# EAGLE schematic Schematic (EAGLE 9.7.0)
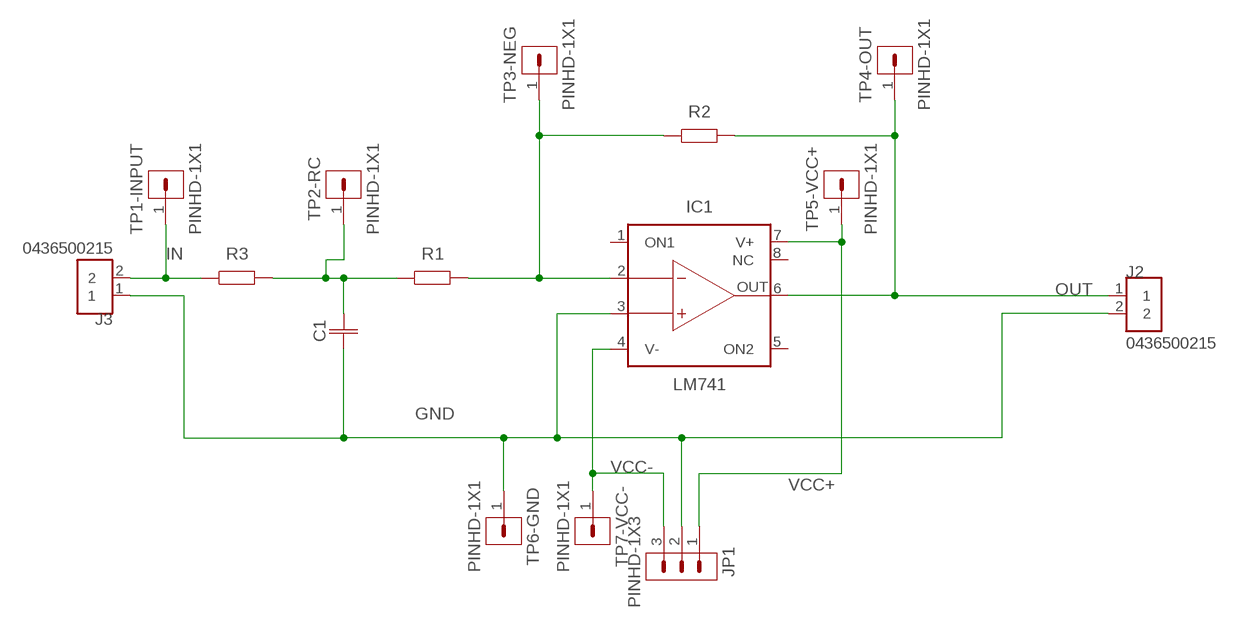
[diagram p0: schematic, sheet 1]

## Parts
C1  C_RADIAL-12.5MM-DIA  [CAPRD550W60D1025H1250B]
IC1  LM741  [DIP826W53P254L959H508Q8B]
J2  0436500215  [0436500215]
J3  0436500215  [0436500215]
JP1  PINHD-1X3  [1X03]
R1  R_AXIAL-7.2MM-PITCH  [RESAD724W46L381D178B]
R2  R_AXIAL-7.2MM-PITCH  [RESAD724W46L381D178B]
R3  R_AXIAL-7.2MM-PITCH  [RESAD724W46L381D178B]
TP1-INPUT  PINHD-1X1  [1X01]
TP2-RC  PINHD-1X1  [1X01]
TP3-NEG  PINHD-1X1  [1X01]
TP4-OUT  PINHD-1X1  [1X01]
TP5-VCC+  PINHD-1X1  [1X01]
TP6-GND  PINHD-1X1  [1X01]
TP7-VCC-  PINHD-1X1  [1X01]

## Nets
GND: C1.1 IC1.3(+IN) J2.2 J3.1 JP1.2 TP6-GND.1
IN: J3.2 R3.1 TP1-INPUT.1
N$5: C1.2 R1.1 R3.2 TP2-RC.1
N$6: IC1.2(-IN) R1.2 R2.1 TP3-NEG.1
OUT: IC1.6(OUT) J2.1 R2.2 TP4-OUT.1
VCC+: IC1.7(V+) JP1.1 TP5-VCC+.1
VCC-: IC1.4(V-) JP1.3 TP7-VCC-.1
Unconnected: IC1.1(ON1) IC1.5(ON2) IC1.8(NC)

## Library data of the parts
C1 = Capacitor:C: Capacitor - Generic
IC1 = IC_Linear:LM741: Operational Amplifier Reference Datasheet <https://www.ti.com/lit/ds/symlink/lm741.pdf>
J2 J3 = Headers:0436500215: CONN HEADER VERT 2POS 3MM Manufacturer's datasheet <https://www.molex.com/pdm_docs/sd/436500215_sd.pdf>
JP1 = Connector:PINHD-1X3: Pin Header
R1-R3 = Resistor:R: Resistor Fixed - Generic
TP1-INPUT TP2-RC TP3-NEG TP4-OUT TP5-VCC+ TP6-GND TP7-VCC- = Connector:PINHD-1X1: Pin Header